# Altium project AVP32F08_EVM_Rev1.1.PrjPcb
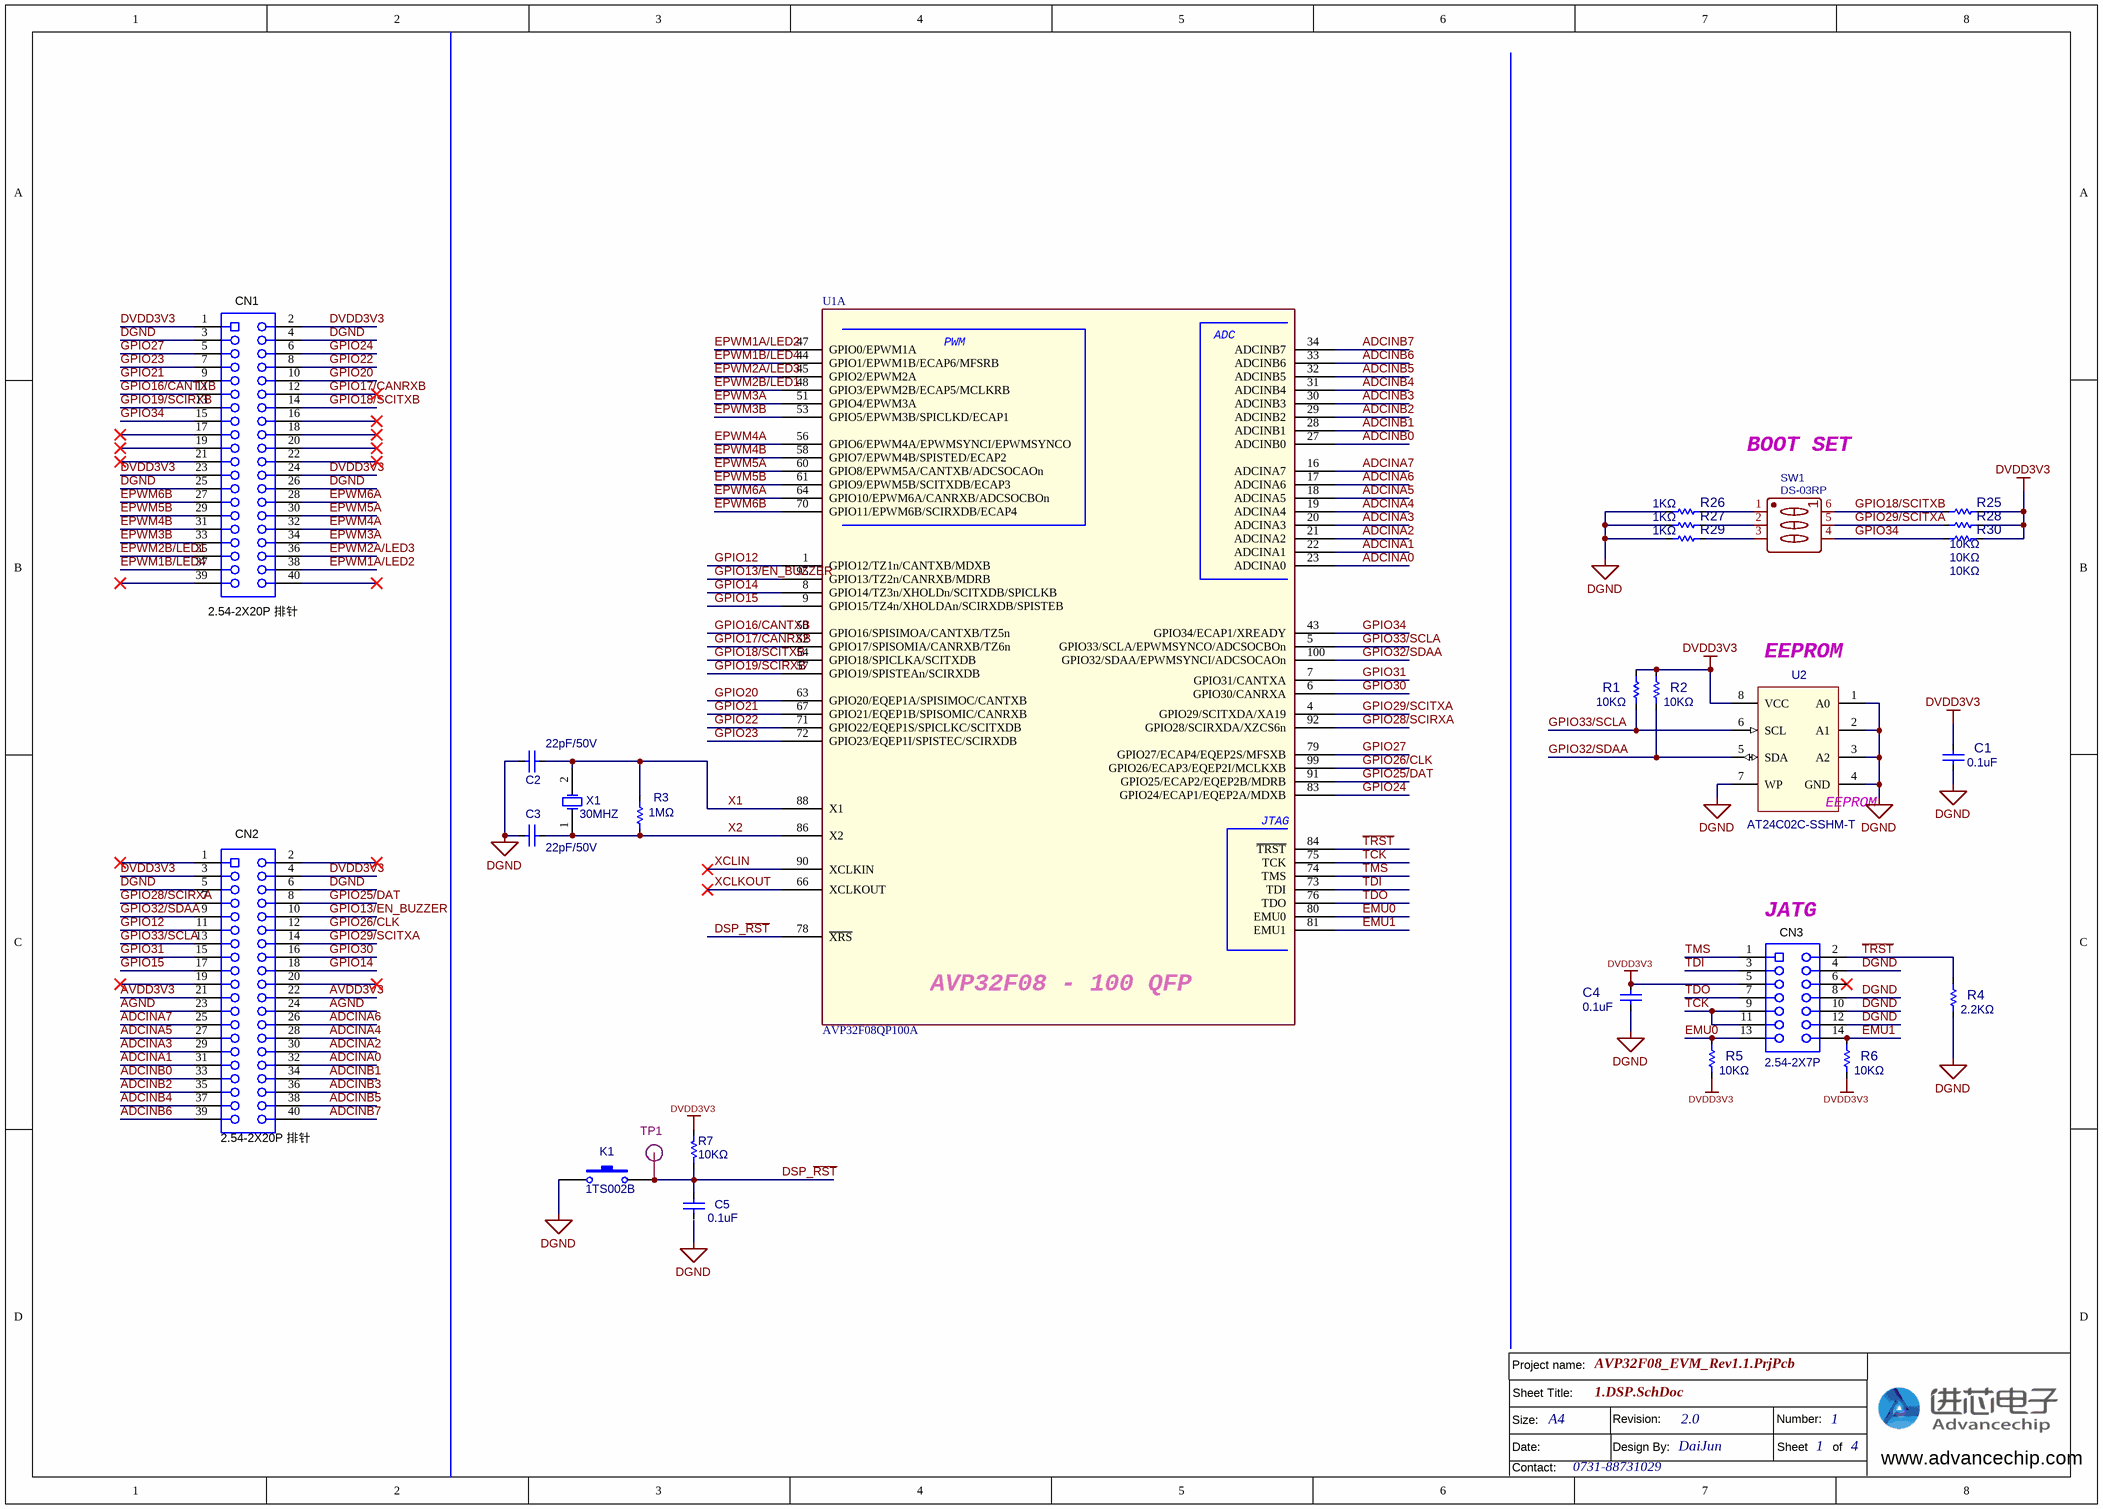
[diagram p0: 1.DSP.SchDoc]
4 sheets, 139 parts. Net scope: global (net labels, ports and power ports of the same name join across sheets).
Board file: AVP32F08_EVM_Rev1.1.PcbDoc
Sheets:
  1.DSP.SchDoc
  2.Power.SchDoc
  3.uC Peripheral.SchDoc
  4.Communication Interface.SchDoc

## Sheet 1.DSP.SchDoc
size A3; Date: 21/11/16; Author: DaiJun; Revision: 2.0; SheetNumber: 1; SheetTotal: 4; Size: A4; Contact: 0731-88731029

### Parts
C1  value 0.1uF  [0603CX]  (hidden comment: 0.1uF/50V)
C2  22pF/50V  [0603cx]
C3  22pF/50V  [0603CX]
C4  value 0.1uF  [0603CX]  (hidden comment: 0.1uF/50V)
C5  value 0.1uF  [C0603]  (hidden comment: 0.1uF/50V)
CN1  2.54-2X20P 排针  [IDC2X20]
CN2  2.54-2X20P 排针  [IDC2X20]
CN3  value 2.54-2X7P  [IDC14-L]  (hidden comment: 2.54-2X7P 简易牛角母座)
K1  value 1TS002B  [SW-3X6]  (hidden comment: 1TS002B-2400-5001-CT)
R1  10KΩ  [0603RX]
R2  10KΩ  [0603RX]
R3  1MΩ  [0603RX]
R4  2.2KΩ  [0603RX]
R5  10KΩ  [0603RX]
R6  10KΩ  [0603RX]
R7  10KΩ  [R0603]
R25  10KΩ  [0603RX]
R26  1KΩ  [0603RX]
R27  1KΩ  [0603RX]
R28  10KΩ  [0603RX]
R29  1KΩ  [0603RX]
R30  10KΩ  [0603RX]
SW1  DS-03RP  [DS-03RP]
TP1  RST  [TEST-0.8/1.5MM]  (value not drawn)
U1  AVP32F08QP100A  [LQFP-100]  (part A of 2)
U2  AT24C02C-SSHM-T  [SO-8]
X1  value 30MHZ  [XTAL_5032]  (hidden comment: X503230MSB2GI)

### Nets
AGND: CN2.23 CN2.24
AVDD3V3: CN2.21 CN2.22
DGND: C1.2 C2.2 C3.1 C4.2 CN1.3 CN1.4 CN1.25 CN1.26 CN2.5 CN2.6 CN3.4 CN3.8 CN3.10 CN3.12 K1.2 R4.1 R26.2 R27.2 R29.2 U2.1(A0) U2.2(A1) U2.3(A2) U2.4(GND) U2.7(WP)
DVDD3V3: C1.1 C4.1 CN1.1 CN1.2 CN1.23 CN1.24 CN2.3 CN2.4 CN3.5 R1.2 R2.2 R5.1 R6.1 R7.1 R25.1 R28.1 R30.1 U2.8(VCC)
ADCINA0: CN2.32 U1.23(ADCINA0)
ADCINA1: CN2.31 U1.22(ADCINA1)
ADCINA2: CN2.30 U1.21(ADCINA2)
ADCINA3: CN2.29 U1.20(ADCINA3)
ADCINA4: CN2.28 U1.19(ADCINA4)
ADCINA5: CN2.27 U1.18(ADCINA5)
ADCINA6: CN2.26 U1.17(ADCINA6)
ADCINA7: CN2.25 U1.16(ADCINA7)
ADCINB0: CN2.33 U1.27(ADCINB0)
ADCINB1: CN2.34 U1.28(ADCINB1)
ADCINB2: CN2.35 U1.29(ADCINB2)
ADCINB3: CN2.36 U1.30(ADCINB3)
ADCINB4: CN2.37 U1.31(ADCINB4)
ADCINB5: CN2.38 U1.32(ADCINB5)
ADCINB6: CN2.39 U1.33(ADCINB6)
ADCINB7: CN2.40 U1.34(ADCINB7)
DSP_~{RST}: C5.1 K1.1 R7.2 TP1.1 U1.78(~{XRS})
EMU0: CN3.13 R5.2 U1.80(EMU0)
EMU1: CN3.14 R6.2 U1.81(EMU1)
EPWM1A/LED2: CN1.38 U1.47(GPIO0/EPWM1A)
EPWM1B/LED4: CN1.37 U1.44(GPIO1/EPWM1B/ECAP6/MFSRB)
EPWM2A/LED3: CN1.36 U1.45(GPIO2/EPWM2A)
EPWM2B/LED1: CN1.35 U1.48(GPIO3/EPWM2B/ECAP5/MCLKRB)
EPWM3A: CN1.34 U1.51(GPIO4/EPWM3A)
EPWM3B: CN1.33 U1.53(GPIO5/EPWM3B/SPICLKD/ECAP1)
EPWM4A: CN1.32 U1.56(GPIO6/EPWM4A/EPWMSYNCI/EPWMSYNCO)
EPWM4B: CN1.31 U1.58(GPIO7/EPWM4B/SPISTED/ECAP2)
EPWM5A: CN1.30 U1.60(GPIO8/EPWM5A/CANTXB/ADCSOCAOn)
EPWM5B: CN1.29 U1.61(GPIO9/EPWM5B/SCITXDB/ECAP3)
EPWM6A: CN1.28 U1.64(GPIO10/EPWM6A/CANRXB/ADCSOCBOn)
EPWM6B: CN1.27 U1.70(GPIO11/EPWM6B/SCIRXDB/ECAP4)
GPIO12: CN2.11 U1.1(GPIO12/TZ1n/CANTXB/MDXB)
GPIO13/EN_BUZZER: CN2.10 U1.95(GPIO13/TZ2n/CANRXB/MDRB)
GPIO14: CN2.18 U1.8(GPIO14/TZ3n/XHOLDn/SCITXDB/SPICLKB)
GPIO15: CN2.17 U1.9(GPIO15/TZ4n/XHOLDAn/SCIRXDB/SPISTEB)
GPIO16/CANTXB: CN1.11 U1.50(GPIO16/SPISIMOA/CANTXB/TZ5n)
GPIO17/CANRXB: CN1.12 U1.52(GPIO17/SPISOMIA/CANRXB/TZ6n)
GPIO18/SCITXB: CN1.14 R25.2 SW1.6(PIN6) U1.54(GPIO18/SPICLKA/SCITXDB)
GPIO19/SCIRXB: CN1.13 U1.57(GPIO19/SPISTEAn/SCIRXDB)
GPIO20: CN1.10 U1.63(GPIO20/EQEP1A/SPISIMOC/CANTXB)
GPIO21: CN1.9 U1.67(GPIO21/EQEP1B/SPISOMIC/CANRXB)
GPIO22: CN1.8 U1.71(GPIO22/EQEP1S/SPICLKC/SCITXDB)
GPIO23: CN1.7 U1.72(GPIO23/EQEP1I/SPISTEC/SCIRXDB)
GPIO24: CN1.6 U1.83(GPIO24/ECAP1/EQEP2A/MDXB)
GPIO25/DAT: CN2.8 U1.91(GPIO25/ECAP2/EQEP2B/MDRB)
GPIO26/CLK: CN2.12 U1.99(GPIO26/ECAP3/EQEP2I/MCLKXB)
GPIO27: CN1.5 U1.79(GPIO27/ECAP4/EQEP2S/MFSXB)
GPIO28/SCIRXA: CN2.7 U1.92(GPIO28/SCIRXDA/XZCS6n)
GPIO29/SCITXA: CN2.14 R28.2 SW1.5(PIN5) U1.4(GPIO29/SCITXDA/XA19)
GPIO30: CN2.16 U1.6(GPIO30/CANRXA)
GPIO31: CN2.15 U1.7(GPIO31/CANTXA)
GPIO32/SDAA: CN2.9 R2.1 U1.100(GPIO32/SDAA/EPWMSYNCI/ADCSOCAOn) U2.5(SDA)
GPIO33/SCLA: CN2.13 R1.1 U1.5(GPIO33/SCLA/EPWMSYNCO/ADCSOCBOn) U2.6(SCL)
GPIO34: CN1.15 R30.2 SW1.4(PIN4) U1.43(GPIO34/ECAP1/XREADY)
~{TRST}: CN3.2 R4.2 U1.84(~{TRST})
TCK: CN3.9 CN3.11 U1.75(TCK)
TDI: CN3.3 U1.73(TDI)
TDO: CN3.7 U1.76(TDO)
TMS: CN3.1 U1.74(TMS)
X1: C2.1 R3.1 U1.88(X1) X1.2(OSC2)
X2: C3.2 R3.2 U1.86(X2) X1.1(OSC1)
XCLIN: U1.90(XCLKIN)
XCLKOUT: U1.66(XCLKOUT)
NetR26_1: R26.1 SW1.1(PIN1)
NetR27_1: R27.1 SW1.2(PIN2)
NetR29_1: R29.1 SW1.3(PIN3)

Not connected (* = marked no-connect by the designer): C5 2; CN1 16* 17* 18* 19* 20* 21* 22* 39* 40*; CN2 1* 2* 19* 20*; CN3 6*

### Notes on the sheet
- BOOT SET
- (near U2) EEPROM
- (near CN3) JATG
- Sheet Title:
- Project name:
- Size:
- Date:
- Contact:
- Revision:
- Design By:
- Number:
- Sheet       of
- www.advancechip.com
- (in symbol AT24C02C) EEPROM
- (in symbol AVP32F08QP100, part A) ADC; PWM; JTAG; AVP32F08 - 100 QFP

### Library data of the parts
C1 C4 C5 = Cap: 贴片电容; Published: 8-Jun-2000; LatestRevisionDate: 17-Jul-2002; LatestRevisionNote: Re-released for DXP Platform.; Publisher: Altium Limited
C2 C3 = Cap: COG贴片电容; Value: 100pF; Published: 8-Jun-2000; LatestRevisionDate: 17-Jul-2002; LatestRevisionNote: Re-released for DXP Platform.; Publisher: Altium Limited
CN1 CN2 = CON 20X2A: 连接器
CN3 = Receptacle_7X2: 连接器
K1 = SW-PB: 鸿源精密轻触开关3X6; Published: 24-Mar-1999; LatestRevisionDate: 17-Jul-2002; LatestRevisionNote: Re-released for DXP Platform.; Publisher: Altium Limited
R1-R7 R25-R30 = Res: 贴片电阻; Value: 1K; Published: 8-Jun-2000; LatestRevisionDate: 17-Jul-2002; LatestRevisionNote: Re-released for DXP Platform.; Publisher: Altium Limited
SW1 = DS-03RP_C458086: BOM_Manufacturer: Korean Hroparts Elec; Contributor: LCSC; BOM_Supplier: LCSC; BOM_Supplier Part: C458086; BOM_Manufacturer Part: DS-03RP; BOM_JLCPCB Part Class: Extended Part; spicePre: S; spiceSymbolName: DS-03RP_C458086
TP1 = TP: 测试点
U1 = AVP32F08QP100: 进芯32位DSP
U2 = AT24C02C: EEPROM存储器
X1 = XTAL: 5032贴片无源晶振 30MHZ; Published: 8-Jun-2000; LatestRevisionDate: 17-Jul-2002; LatestRevisionNote: Re-released for DXP Platform.; Supply: https://item.szlcsc.com/113796.html

## Sheet 2.Power.SchDoc: TopLevel Schematic
size A3; Date: 21/11/16; Author: Daijun; Revision: 2.0; SheetNumber: 2; SheetTotal: 4; Size: A4; Contact: 0731-88731029
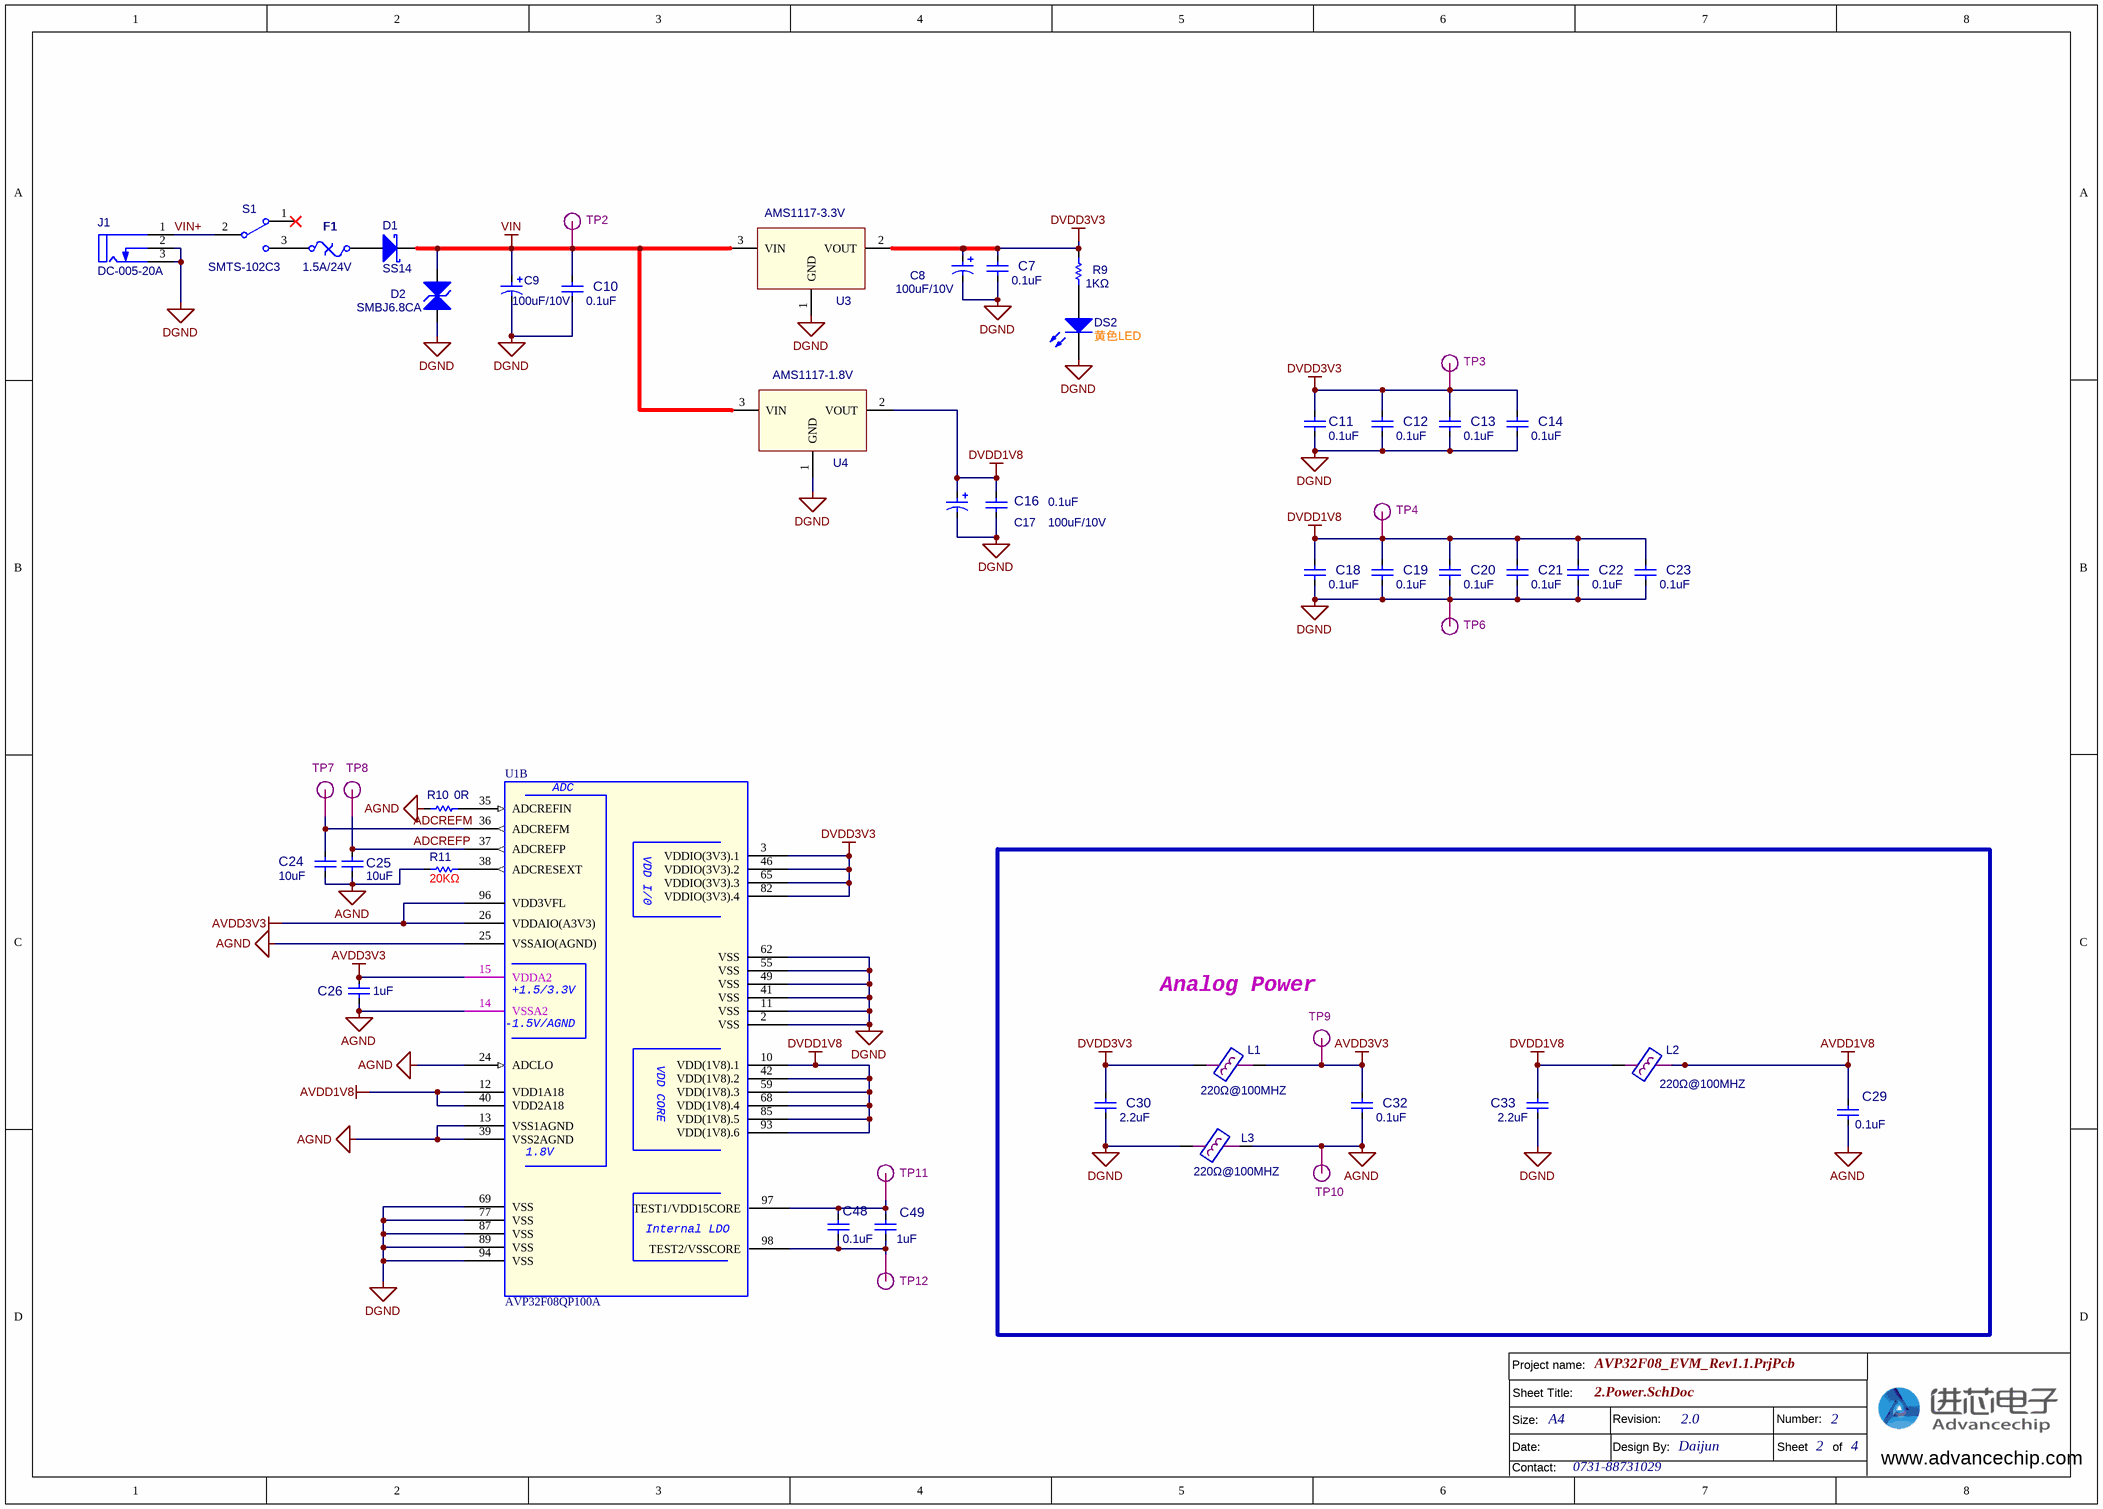
[diagram p1: 2.Power.SchDoc]

### Parts
C7  value 0.1uF  [0603CX]  (hidden comment: 0.1uF/50V)
C8  100uF/10V  [CASE-B-3528]
C9  100uF/10V  [CASE-B-3528]
C10  value 0.1uF  [0603CX]  (hidden comment: 0.1uF/50V)
C11  value 0.1uF  [0603CX]  (hidden comment: 0.1uF/50V)
C12  value 0.1uF  [0603CX]  (hidden comment: 0.1uF/50V)
C13  value 0.1uF  [0603CX]  (hidden comment: 0.1uF/50V)
C14  value 0.1uF  [0603CX]  (hidden comment: 0.1uF/50V)
C16  value 0.1uF  [0603CX]  (hidden comment: 0.1uF/50V)
C17  100uF/10V  [CASE-B-3528]
C18  value 0.1uF  [0603CX]  (hidden comment: 0.1uF/50V)
C19  value 0.1uF  [0603CX]  (hidden comment: 0.1uF/50V)
C20  value 0.1uF  [0603CX]  (hidden comment: 0.1uF/50V)
C21  value 0.1uF  [0603CX]  (hidden comment: 0.1uF/50V)
C22  value 0.1uF  [0603CX]  (hidden comment: 0.1uF/50V)
C23  value 0.1uF  [0603CX]  (hidden comment: 0.1uF/50V)
C24  value 10uF  [C0805]  (hidden comment: 10uF/10V)
C25  value 10uF  [C0805]  (hidden comment: 10uF/10V)
C26  value 1uF  [0603CX]  (hidden comment: 1uF/25V)
C29  value 0.1uF  [0603CX]  (hidden comment: 0.1uF/50V)
C30  value 2.2uF  [0603CX]  (hidden comment: 0.1uF/50V)
C32  value 0.1uF  [0603CX]  (hidden comment: 0.1uF/50V)
C33  value 2.2uF  [0603CX]  (hidden comment: 0.1uF/50V)
C48  value 0.1uF  [0603CX]  (hidden comment: 0.1uF/50V)
C49  value 1uF  [0603CX]  (hidden comment: 1uF/25V)
D1  SS14  [SMA]
D2  SMBJ6.8CA  [SMB2]
DS2  黄色LED  [SMD_LED0805_LED]
F1  1.5A/24V  [1812_PTC_NP]
J1  DC-005-20A  [DC-005]
L1  value 220Ω@100MHZ  [L-0805]  (hidden comment: BLM21PG221SN)
L2  value 220Ω@100MHZ  [L-0805]  (hidden comment: BLM21PG221SN)
L3  value 220Ω@100MHZ  [L-0805]  (hidden comment: BLM21PG221SN)
R9  1KΩ  [0603RX]
R10  0R  [0603RX]
R11  20KΩ  [0603RX]
S1  SMTS-102C3  [SW2]
TP2  VIN+  [TEST-0.8/1.5MM]  (value not drawn)
TP3  +3V3  [TEST-0.8/1.5MM]  (value not drawn)
TP4  +1V8  [TEST-0.8/1.5MM]  (value not drawn)
TP6  DGND  [Keystone5002]  (value not drawn)
TP7  VREFM  [TEST-0.5/1MM]  (value not drawn)
TP8  VREFP  [TEST-0.5/1MM]  (value not drawn)
TP9  AVCC  [Keystone5002]  (value not drawn)
TP10  AGND  [Keystone5002]  (value not drawn)
TP11  +1.5V  [TEST-0.8/1.5MM]  (value not drawn)
TP12  G  [TEST-0.8/1.5MM]  (value not drawn)
U1  AVP32F08QP100A  [LQFP-100]  (part B of 2)
U3  AMS1117-3.3V  [SOT-223]
U4  AMS1117-1.8V  [SOT-223]

### Blocks framed on the sheet
Analog Power: C29 C30 C32 C33 L1-L3 TP9 TP10

### Nets
AGND: C24.2 C25.2 C26.2 C29.2 C32.2 L3.2 R10.1 R11.1 TP10.1 U1.13(VSS1AGND) U1.14(VSSA2) U1.24(ADCLO) U1.25(VSSAIO(AGND)) U1.39(VSS2AGND)
AVDD1V8: C29.1 L2.2 U1.12(VDD1A18) U1.40(VDD2A18)
AVDD3V3: C26.1 C32.1 L1.2 TP9.1 U1.15(VDDA2) U1.26(VDDAIO(A3V3)) U1.96(VDD3VFL)
DGND: C7.2 C8.2 C9.2 C10.2 C11.2 C12.2 C13.2 C14.2 C16.2 C17.2 C18.2 C19.2 C20.2 C21.2 C22.2 C23.2 C30.2 C33.2 D2.1(A) DS2.2(K) J1.2 J1.3 L3.1 TP6.1 U1.2(VSS) U1.11(VSS) U1.41(VSS) U1.49(VSS) U1.55(VSS) U1.62(VSS) U1.69(VSS) U1.77(VSS) U1.87(VSS) U1.89(VSS) U1.94(VSS) U3.1(GND) U4.1(GND)
DVDD1V8: C16.1 C17.1 C18.1 C19.1 C20.1 C21.1 C22.1 C23.1 C33.1 L2.1 TP4.1 U1.10(VDD(1V8).1) U1.42(VDD(1V8).2) U1.59(VDD(1V8).3) U1.68(VDD(1V8).4) U1.85(VDD(1V8).5) U1.93(VDD(1V8).6) U4.2(VOUT)
DVDD3V3: C7.1 C8.1 C11.1 C12.1 C13.1 C14.1 C30.1 L1.1 R9.1 TP3.1 U1.3(VDDIO(3V3).1) U1.46(VDDIO(3V3).2) U1.65(VDDIO(3V3).3) U1.82(VDDIO(3V3).4) U3.2(VOUT)
VIN: C9.1 C10.1 D1.2 D2.2(K) TP2.1 U3.3(VIN) U4.3(VIN)
ADCREFM: C24.1 TP7.1 U1.36(ADCREFM)
ADCREFP: C25.1 TP8.1 U1.37(ADCREFP)
VIN+: J1.1 S1.2
NetC48_1: C48.1 C49.1 TP11.1 U1.97(TEST1/VDD15CORE)
NetC48_2: C48.2 C49.2 TP12.1 U1.98(TEST2/VSSCORE)
NetD1_1: D1.1 F1.2
NetDS2_1: DS2.1(A) R9.2
NetF1_1: F1.1 S1.3
NetR10_2: R10.2 U1.35(ADCREFIN)
NetR11_2: R11.2 U1.38(ADCRESEXT)

Not connected (* = marked no-connect by the designer): S1 1*

### Notes on the sheet
- Sheet Title:
- Project name:
- Size:
- Date:
- Contact:
- Revision:
- Design By:
- Number:
- Sheet       of
- www.advancechip.com
- (in symbol AVP32F08QP100, part B) ADC; VDD I/0; +1.5/3.3V; -1.5V/AGND; VDD CORE; 1.8V; Internal LDO

### Library data of the parts
C7 C10-C14 C16 C18-C26 C29 C30 C32 C33 C48 C49 = Cap: 贴片电容; Published: 8-Jun-2000; LatestRevisionDate: 17-Jul-2002; LatestRevisionNote: Re-released for DXP Platform.; Publisher: Altium Limited
C8 C9 C17 = CAP2: 钽电容; Brand Name: 三星; Tolerance error: 10%; cost: ￥0.01
D1 = D Schottky: 肖特基二极管; Published: 8-Jun-2000; LatestRevisionDate: 17-Jul-2002; LatestRevisionNote: Re-released for DXP Platform.; Publisher: Altium Limited; Code_JEDEC: DO-214-AA
D2 = TVS: TVS二极管; Published: 8-Jun-2000; LatestRevisionDate: 17-Jul-2002; LatestRevisionNote: Re-released for DXP Platform.; Publisher: Altium Limited
DS2 = LED0: 发光二极管; Published: 8-Jun-2000; LatestRevisionDate: 08-Jul-2005; LatestRevisionNote: Mech Layer 1 removed.; PackageReference: LED-0; Publisher: Altium Limited; PackageDescription: LED; 2 Leads
F1 = Fuse Thermal: 自恢复保险丝; Published: 24-Mar-1999; LatestRevisionDate: 17-Jul-2002; LatestRevisionNote: Re-released for DXP Platform.; PackageReference: PIN-W2/E2.8; Publisher: Altium Limited
J1 = DC-005: DC电源接口，内径2.1mm; Published: 24-Mar-1999; LatestRevisionDate: 17-Jul-2002; LatestRevisionNote: Re-released for DXP Platform.; Publisher: Altium Limited
L1-L3 = FB1: 贴片电感BLM21PG221SN; Code_IEC: 1005; Published: 8-Jun-2000; LatestRevisionDate: 29-May-2009; LatestRevisionNote: IPC-7351 Footprint Added.; PackageReference: 0402-A; Publisher: Altium Limited; PackageDescription: Chip Inductor; Code_JEITA: 0402
R9-R11 = Res: 贴片电阻; Value: 1K; Published: 8-Jun-2000; LatestRevisionDate: 17-Jul-2002; LatestRevisionNote: Re-released for DXP Platform.; Publisher: Altium Limited
S1 = SW-SPDT: 红色卧式弯脚小型扭子开关5脚2档; Published: 24-Mar-1999; LatestRevisionDate: 17-Dec-2003; LatestRevisionNote: Schematic revised, PCB Footprint replaced.; DatasheetDocument: 05-Dec-2000; Publisher: Altium Limited
TP2-TP4 TP6-TP12 = TP: 测试点
U1 = AVP32F08QP100: 进芯32位DSP
U3 U4 = ASM1117-3.3V: 线性稳压器

## Sheet 3.uC Peripheral.SchDoc: TopLevel Schematic
size A3; Date: 21/11/16; Author: Daijun; Revision: 2.0; SheetNumber: 3; SheetTotal: 4; Size: A4; Contact: 0731-88731029; ProjectName: EVM
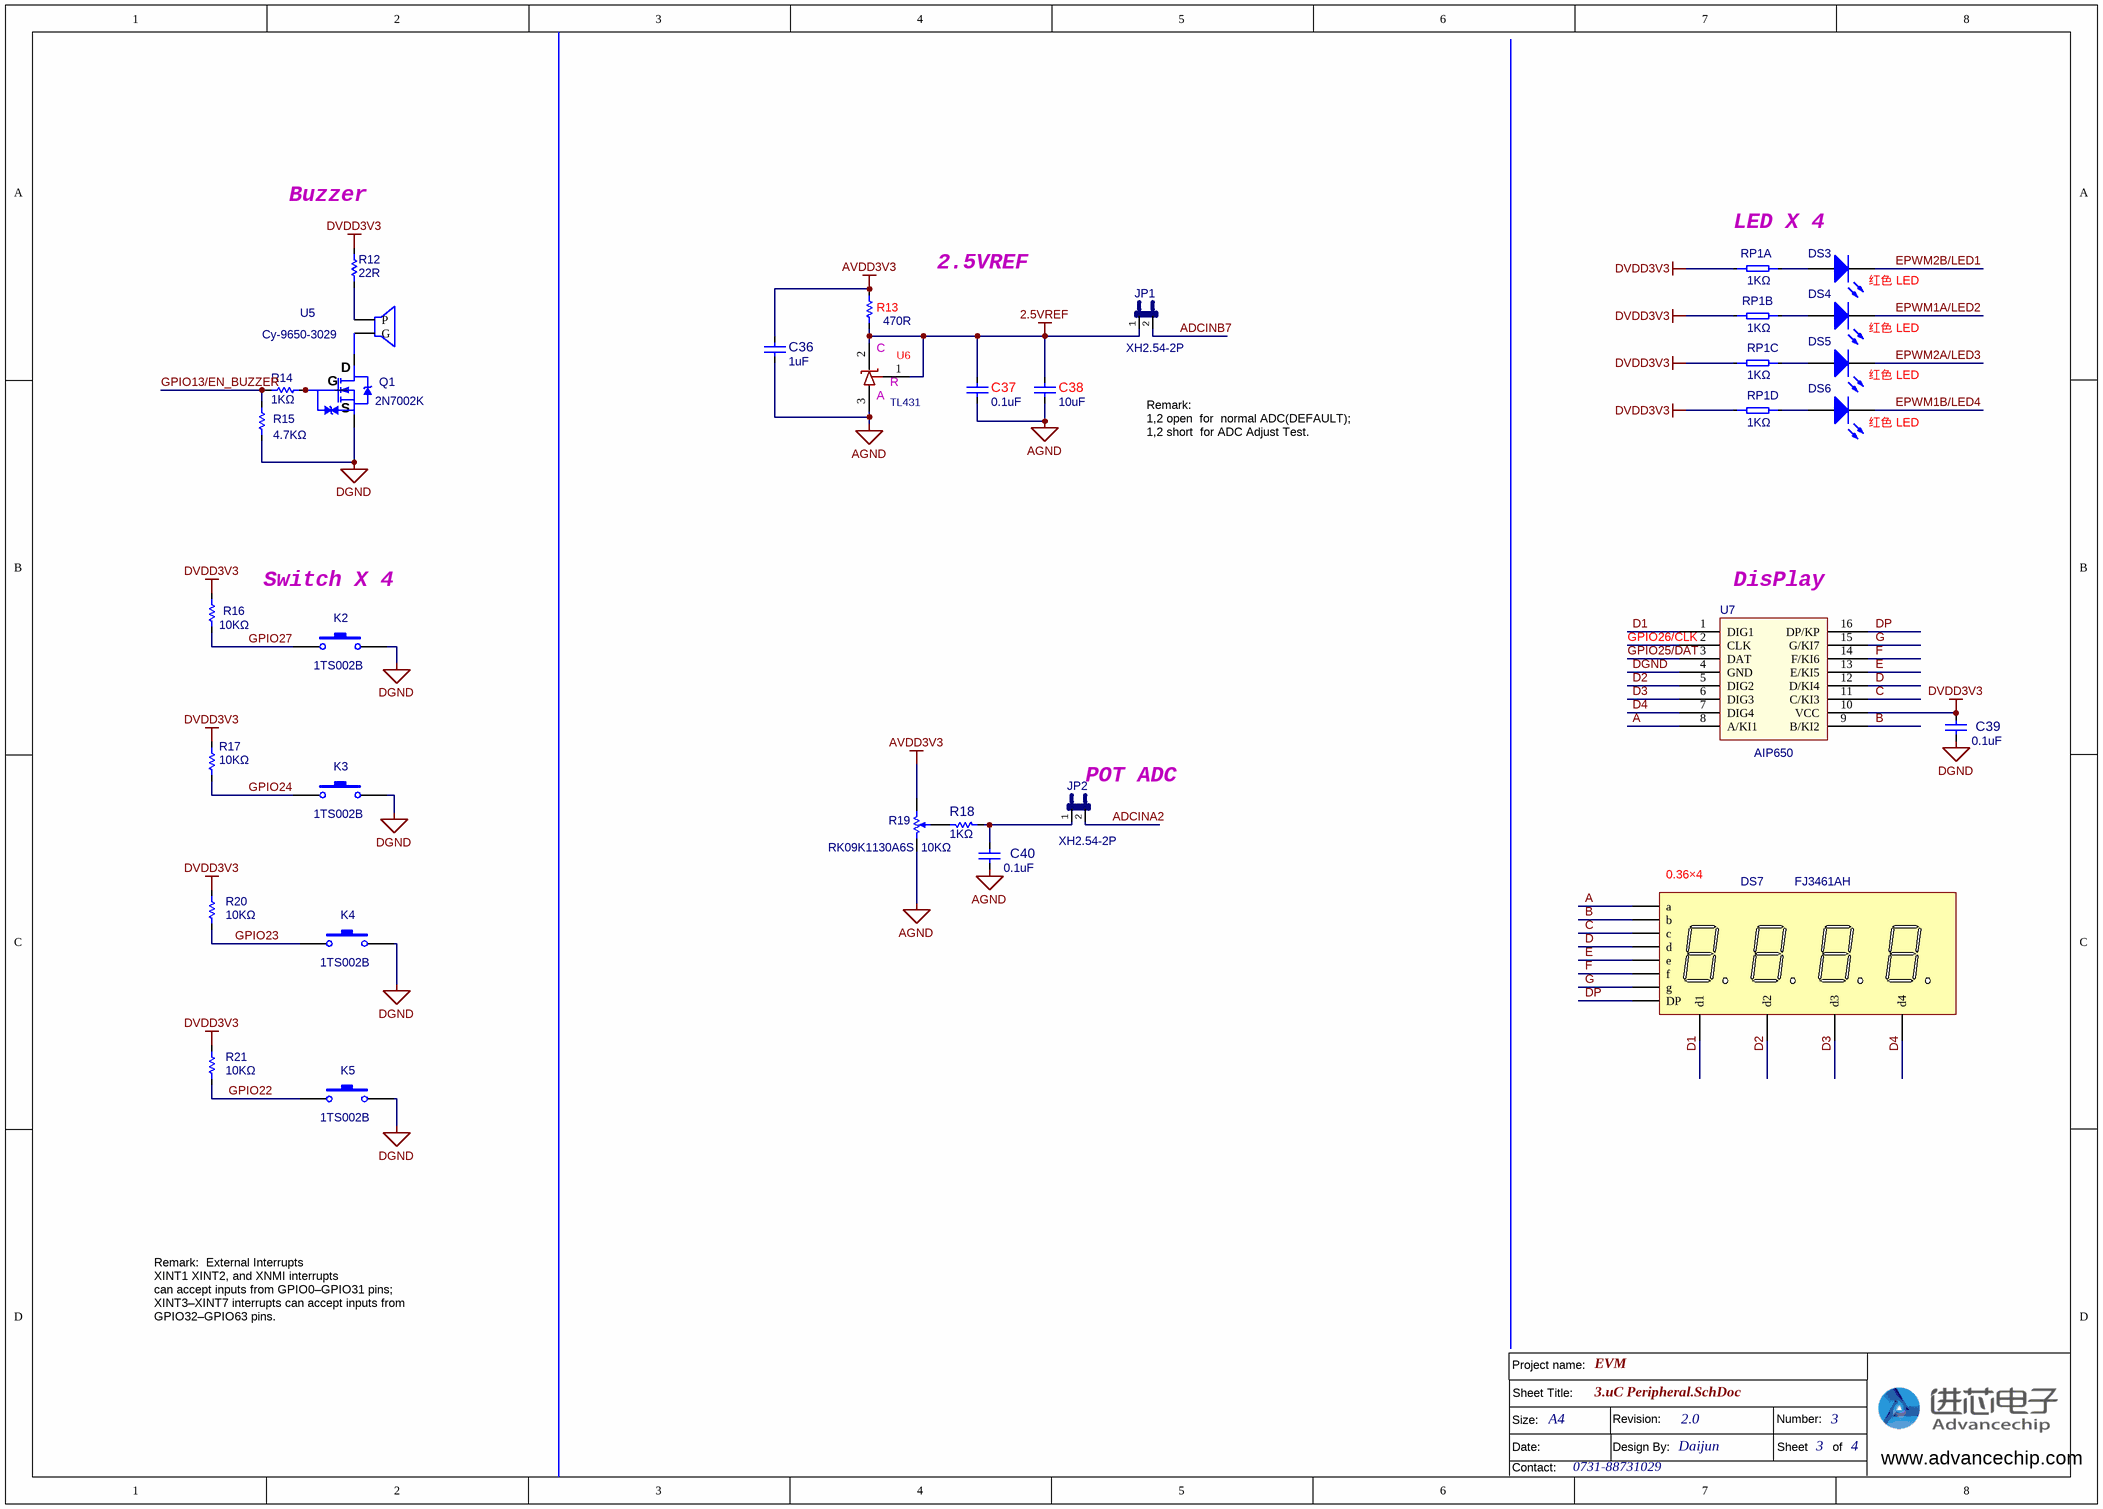
[diagram p2: 3.uC Peripheral.SchDoc]

### Parts
C36  value 1uF  [0603CX]  (hidden comment: 1uF/25V)
C37  value 0.1uF  [0603CX]  (hidden comment: 0.1uF/50V)
C38  value 10uF  [C0805]  (hidden comment: 10uF/10V)
C39  value 0.1uF  [0603CX]  (hidden comment: 0.1uF/50V)
C40  value 0.1uF  [0603CX]  (hidden comment: 0.1uF/50V)
DS3  红色 LED  [SMD_LED0805_LED]
DS4  红色 LED  [SMD_LED0805_LED]
DS5  红色 LED  [SMD_LED0805_LED]
DS6  红色 LED  [SMD_LED0805_LED]
DS7  FJ3461AH  value 0.36×4  [0.36X4]
JP1  XH2.54-2P  [SIP2C]
JP2  XH2.54-2P  [SIP2C]
K2  value 1TS002B  [SW-3X6]  (hidden comment: 1TS002B-2400-5001-CT)
K3  value 1TS002B  [SW-3X6]  (hidden comment: 1TS002B-2400-5001-CT)
K4  value 1TS002B  [SW-3X6]  (hidden comment: 1TS002B-2400-5001-CT)
K5  value 1TS002B  [SW-3X6]  (hidden comment: 1TS002B-2400-5001-CT)
Q1  2N7002K  [MOS-SOT23]
R12  22R  [1206RX]
R13  470R  [0603RX]
R14  1KΩ  [0603RX]
R15  4.7KΩ  [0603RX]
R16  10KΩ  [R0603]
R17  10KΩ  [R0603]
R18  1KΩ  [0603RX]
R19  RK09K1130A6S  10KΩ  [RK09K1130]
R20  10KΩ  [R0603]
R21  10KΩ  [R0603]
RP1  1KΩ  [0603Rx_4P]  (parts A,B,C,D of 4)
U5  Cy-9650-3029  [SUN-0905-3V]
U6  TL431  [SOT-23]
U7  AIP650  [SOIC-16_150mil]

### Nets
2.5VREF: C37.1 C38.1 JP1.1 R13.2 U6.1(R) U6.2(C)
AGND: C36.2 C37.2 C38.2 C40.2 R19.1 U6.3(A)
AVDD3V3: C36.1 R13.1 R19.3
DGND: C39.2 K2.2 K3.2 K4.2 K5.2 Q1.S R15.2 U7.4(GND)
DVDD3V3: C39.1 R12.1 R16.1 R17.1 R20.1 R21.1 RP1.1 RP1.2 RP1.3 RP1.4 U7.10(VCC)
A: DS7.a U7.8(A/KI1)
ADCINA2: JP2.2
ADCINB7: JP1.2
B: DS7.b U7.9(B/KI2)
C: DS7.c U7.11(C/KI3)
D: DS7.d U7.12(D/KI4)
D1: DS7.com1(d1) U7.1(DIG1)
D2: DS7.com2(d2) U7.5(DIG2)
D3: DS7.com3(d3) U7.6(DIG3)
D4: DS7.com4(d4) U7.7(DIG4)
DP: DS7.dp(DP) U7.16(DP/KP)
E: DS7.e U7.13(E/KI5)
EPWM1A/LED2: DS4.2(K)
EPWM1B/LED4: DS6.2(K)
EPWM2A/LED3: DS5.2(K)
EPWM2B/LED1: DS3.2(K)
F: DS7.f U7.14(F/KI6)
G: DS7.g U7.15(G/KI7)
GPIO13/EN_BUZZER: R14.2 R15.1
GPIO22: K5.1 R21.2
GPIO23: K4.1 R20.2
GPIO24: K3.1 R17.2
GPIO25/DAT: U7.3(DAT)
GPIO26/CLK: U7.2(CLK)
GPIO27: K2.1 R16.2
NetC40_1: C40.1 JP2.1 R18.2
NetDS3_1: DS3.1(A) RP1.8
NetDS4_1: DS4.1(A) RP1.7
NetDS5_1: DS5.1(A) RP1.6
NetDS6_1: DS6.1(A) RP1.5
NetQ1_D: Q1.D U5.2(G)
NetQ1_G: Q1.G R14.1
NetR12_2: R12.2 U5.1(P)
NetR18_1: R18.1 R19.2

### Notes on the sheet
- (near R12) Buzzer
- LED X 4
- 2.5VREF
- Remark:
  1,2 open  for  normal ADC(DEFAULT);
  1,2 short  for ADC Adjust Test.
- Switch X 4
- (near U7) DisPlay
- (near JP2) POT ADC
- Remark:  External Interrupts
  XINT1 XINT2, and XNMI interrupts
  can accept inputs from GPIO0–GPIO31 pins;
  XINT3–XINT7 interrupts can accept inputs from
  GPIO32–GPIO63 pins.
- Sheet Title:
- Project name:
- Size:
- Date:
- Contact:
- Revision:
- Design By:
- Number:
- Sheet       of
- www.advancechip.com

### Library data of the parts
C36-C40 = Cap: 贴片电容; Published: 8-Jun-2000; LatestRevisionDate: 17-Jul-2002; LatestRevisionNote: Re-released for DXP Platform.; Publisher: Altium Limited
DS3-DS6 = LED0: 发光二极管; Published: 8-Jun-2000; LatestRevisionDate: 08-Jul-2005; LatestRevisionNote: Mech Layer 1 removed.; PackageReference: LED-0; Publisher: Altium Limited; PackageDescription: LED; 2 Leads
DS7 = Dpy Amber-4K: 4位0.36英寸红色共阴七段数码管; 焊接类型: 直插; ComponentLink1URL: *; ComponentLink2Description: *; ComponentLink2URL: *; ComponentLink3Description: *; ComponentLink3URL: *; Pin: 12
JP1 JP2 = JP2: 连接器+跳线帽
K2-K5 = SW-PB: 鸿源精密轻触开关3X6; Published: 24-Mar-1999; LatestRevisionDate: 17-Jul-2002; LatestRevisionNote: Re-released for DXP Platform.; Publisher: Altium Limited
Q1 = 2SK3019: N-MOSFET 60V300mA低开启电压; Published: 8-Jun-2000; LatestRevisionDate: 17-Jul-2002; LatestRevisionNote: Re-released for DXP Platform.; Publisher: Altium Limited
R12 R14-R18 R20 R21 = Res: 贴片电阻; Value: 1K; Published: 8-Jun-2000; LatestRevisionDate: 17-Jul-2002; LatestRevisionNote: Re-released for DXP Platform.; Publisher: Altium Limited
R13 = Res: 贴片电阻; Temperature Coefficient: 100ppm/ ℃; Tolerance: 1%; Voltage Rating: 75V; Power Rating: 1/10W; Operating Temperature Range: -55~+125℃; Category: 贴片电阻; PackageReference: 0603; Composition: Thick Film; MountType: Surface Mount (SMD - SMT); RoHS: Y; Supplier 2: 1; Storage Room  Code: 000000
R19 = RPot SM: 立式可调电位器; Published: 17-Dec-2003; DatasheetDocument: Oct-2003; Publisher: Altium Limited
RP1 = Res Pack3: 贴片排阻; Value: 1K; Published: 24-Mar-1999; LatestRevisionDate: 17-Jul-2002; LatestRevisionNote: Re-released for DXP Platform.; Publisher: Altium Limited; Code_JEDEC: MO-150-AC
U5 = BEEP: 超音V有源蜂鸣器 电磁式 脚距5,外径9.5mm
U6 = AZ431AN-ATRE1: 2.5V基准芯片 0.5%, 1R,2C,3A; spiceSymbolName: https://item.szlcsc.com/192500.html
U7 = AIP650E: 无锡中微LED驱动芯片

## Sheet 4.Communication Interface.SchDoc
size A3; Date: 21/11/16; Author: Daijun; Revision: 2.0; SheetNumber: 4; SheetTotal: 4; Size: A3; Contact: 0731-88731029
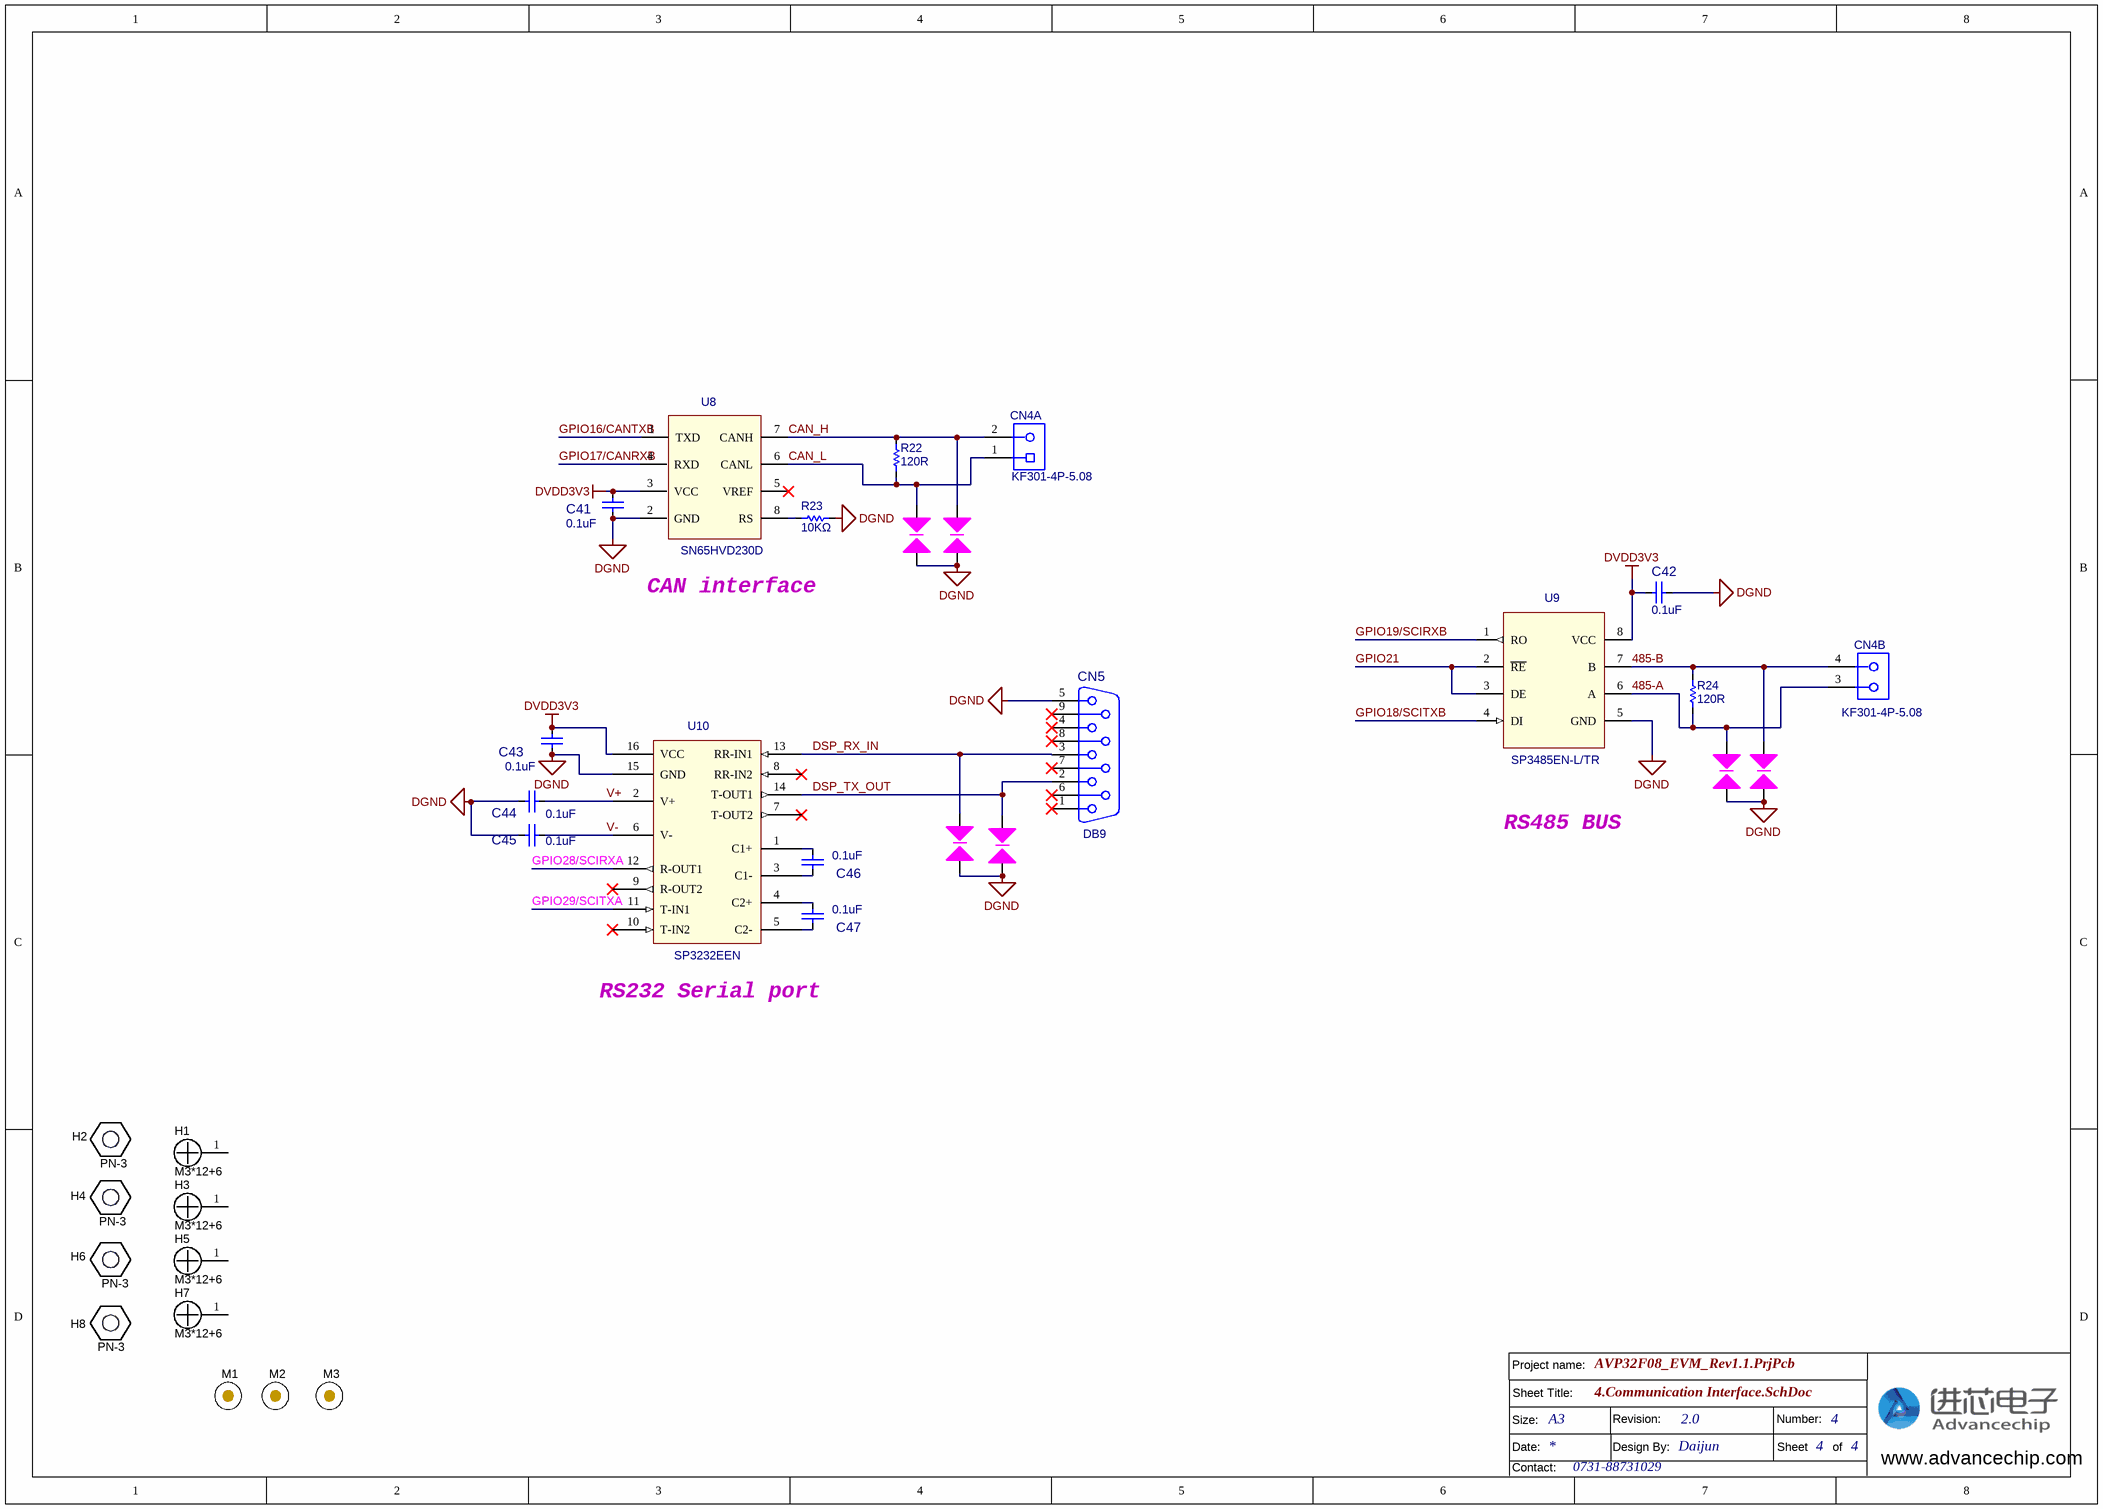
[diagram p3: 4.Communication Interface.SchDoc]

### Parts
C41  value 0.1uF  [0603CX]  (hidden comment: 0.1uF/50V)
C42  value 0.1uF  [0603CX]  (hidden comment: 0.1uF/50V)
C43  value 0.1uF  [0603CX]  (hidden comment: 0.1uF/50V)
C44  value 0.1uF  [0603CX]  (hidden comment: 0.1uF/50V)
C45  value 0.1uF  [0603CX]  (hidden comment: 0.1uF/50V)
C46  value 0.1uF  [0603CX]  (hidden comment: 0.1uF/50V)
C47  value 0.1uF  [0603CX]  (hidden comment: 0.1uF/50V)
CN4  KF301-4P-5.08  [J-DG128-4]  (parts A,B of 2)
CN5  DB9  [db9]
H1  M3*12+6  [NY PMS 440 0025 PH]
H2  PN-3  [Keystone_1902C]
H3  M3*12+6  [NY PMS 440 0025 PH]
H4  PN-3  [Keystone_1902C]
H5  M3*12+6  [NY PMS 440 0025 PH]
H6  PN-3  [Keystone_1902C]
H7  M3*12+6  [NY PMS 440 0025 PH]
H8  PN-3  [Keystone_1902C]
M1  (no value)  [Mark1]
M2  (no value)  [Mark1]
M3  (no value)  [Mark1]
R22  120R  [1206RX]
R23  10KΩ  [0603RX]
R24  120R  [1206RX]
T1  SPARK_GAP  [SPARK_GAP]  (value not drawn)
T2  SPARK_GAP  [SPARK_GAP]  (value not drawn)
T3  SPARK_GAP  [SPARK_GAP]  (value not drawn)
T4  SPARK_GAP  [SPARK_GAP]  (value not drawn)
T5  SPARK_GAP  [SPARK_GAP]  (value not drawn)
T6  SPARK_GAP  [SPARK_GAP]  (value not drawn)
U8  SN65HVD230D  [SO-8]
U9  SP3485EN-L/TR  [SO-8]
U10  SP3232EEN  [SOIC-16_150mil]

### Nets
DGND: C41.2 C42.2 C43.2 C44.2 C45.2 CN5.5 R23.1 T1.2(A) T2.2(A) T3.2(A) T4.2(A) T5.2(A) T6.2(A) U8.2(GND) U9.5(GND) U10.15(GND)
DVDD3V3: C41.1 C42.1 C43.1 U8.3(VCC) U9.8(VCC) U10.16(VCC)
485-A: CN4.3 R24.1 T3.1(A) U9.6(A)
485-B: CN4.4 R24.2 T4.1(A) U9.7(B)
CAN_H: CN4.2 R22.2 T2.1(A) U8.7(CANH)
CAN_L: CN4.1 R22.1 T1.1(A) U8.6(CANL)
DSP_RX_IN: CN5.3 T5.1(A) U10.13(RR-IN1)
DSP_TX_OUT: CN5.2 T6.1(A) U10.14(T-OUT1)
GPIO16/CANTXB: U8.1(TXD)
GPIO17/CANRXB: U8.4(RXD)
GPIO18/SCITXB: U9.4(DI)
GPIO19/SCIRXB: U9.1(RO)
GPIO21: U9.2(~{RE}) U9.3(DE)
GPIO28/SCIRXA: U10.12(R-OUT1)
GPIO29/SCITXA: U10.11(T-IN1)
V+: C44.1 U10.2(V+)
V-: C45.1 U10.6(V-)
NetC46_1: C46.1 U10.1(C1+)
NetC46_2: C46.2 U10.3(C1-)
NetC47_1: C47.1 U10.4(C2+)
NetC47_2: C47.2 U10.5(C2-)
NetR23_2: R23.2 U8.8(RS)

Not connected (* = marked no-connect by the designer): CN5 1* 4* 6* 7* 8* 9*; H1 1; H3 1; H5 1; H7 1; U8 5(VREF)*; U10 7(T-OUT2)* 8(RR-IN2)* 9(R-OUT2)* 10(T-IN2)*

### Notes on the sheet
- CAN interface
- RS485 BUS
- RS232 Serial port
- Sheet Title:
- Project name:
- Size:
- Date:
- Contact:
- Revision:
- Design By:
- Number:
- Sheet       of
- www.advancechip.com

### Library data of the parts
C41-C47 = Cap: 贴片电容; Published: 8-Jun-2000; LatestRevisionDate: 17-Jul-2002; LatestRevisionNote: Re-released for DXP Platform.; Publisher: Altium Limited
CN4 = CON4: 连接器
CN5 = D Connector 9: DB9插座; PackageDocument: O; Positions: 9; Gender: Receptacle; Published: 15-Jun-2001; LatestRevisionDate: 17-Jul-2002; LatestRevisionNote: Re-released for DXP Platform.; DatasheetDocument: 1-Sep-1999; PackageReference: 788750; Publisher: Altium Limited; Orientation: Right Angle
H1 H3 H5 H7 = CMP-0003617-1: 安装孔
H2 H4 H6 H8 = CMP-0003610-1: Standoff, Hex, 0.5"L #4-40 Nylon
M1-M3 = CMP-0077181-1: MARK点
R22 = Res: 贴片电阻; Published: 8-Jun-2000; LatestRevisionDate: 17-Jul-2002; LatestRevisionNote: Re-released for DXP Platform.; Publisher: Altium Limited
R23 R24 = Res: 贴片电阻; Value: 1K; Published: 8-Jun-2000; LatestRevisionDate: 17-Jul-2002; LatestRevisionNote: Re-released for DXP Platform.; Publisher: Altium Limited
T1-T6 = GND SIDE: 静电GAP
U8 = SN65HVD230D: 3.3V CAN通讯
U9 = SP3485E: 3.3V 485总线收发器
U10 = MAX232: 低压232通讯芯片

## Nets that join several sheets
AGND: 1.DSP (CN2.23 CN2.24), 2.Power (14 pins), 3.uC Peripheral (6 pins)
AVDD3V3: 1.DSP (CN2.21 CN2.22), 2.Power (7 pins), 3.uC Peripheral (C36.1 R13.1 R19.3)
DGND: 1.DSP (24 pins), 2.Power (37 pins), 3.uC Peripheral (8 pins), 4.Communication Interface (16 pins)
DVDD3V3: 1.DSP (18 pins), 2.Power (15 pins), 3.uC Peripheral (11 pins), 4.Communication Interface (6 pins)
ADCINA2: 1.DSP (CN2.30 U1.21), 3.uC Peripheral (JP2.2)
ADCINB7: 1.DSP (CN2.40 U1.34), 3.uC Peripheral (JP1.2)
EPWM1A/LED2: 1.DSP (CN1.38 U1.47), 3.uC Peripheral (DS4.2)
EPWM1B/LED4: 1.DSP (CN1.37 U1.44), 3.uC Peripheral (DS6.2)
EPWM2A/LED3: 1.DSP (CN1.36 U1.45), 3.uC Peripheral (DS5.2)
EPWM2B/LED1: 1.DSP (CN1.35 U1.48), 3.uC Peripheral (DS3.2)
GPIO13/EN_BUZZER: 1.DSP (CN2.10 U1.95), 3.uC Peripheral (R14.2 R15.1)
GPIO16/CANTXB: 1.DSP (CN1.11 U1.50), 4.Communication Interface (U8.1)
GPIO17/CANRXB: 1.DSP (CN1.12 U1.52), 4.Communication Interface (U8.4)
GPIO18/SCITXB: 1.DSP (CN1.14 R25.2 SW1.6 U1.54), 4.Communication Interface (U9.4)
GPIO19/SCIRXB: 1.DSP (CN1.13 U1.57), 4.Communication Interface (U9.1)
GPIO21: 1.DSP (CN1.9 U1.67), 4.Communication Interface (U9.2 U9.3)
GPIO22: 1.DSP (CN1.8 U1.71), 3.uC Peripheral (K5.1 R21.2)
GPIO23: 1.DSP (CN1.7 U1.72), 3.uC Peripheral (K4.1 R20.2)
GPIO24: 1.DSP (CN1.6 U1.83), 3.uC Peripheral (K3.1 R17.2)
GPIO25/DAT: 1.DSP (CN2.8 U1.91), 3.uC Peripheral (U7.3)
GPIO26/CLK: 1.DSP (CN2.12 U1.99), 3.uC Peripheral (U7.2)
GPIO27: 1.DSP (CN1.5 U1.79), 3.uC Peripheral (K2.1 R16.2)
GPIO28/SCIRXA: 1.DSP (CN2.7 U1.92), 4.Communication Interface (U10.12)
GPIO29/SCITXA: 1.DSP (CN2.14 R28.2 SW1.5 U1.4), 4.Communication Interface (U10.11)